# Altium schematic sheet CGM.SchDoc: CGM
size B; Author: Rahimzadeh; SheetNumber: 1; SheetTotal: 1
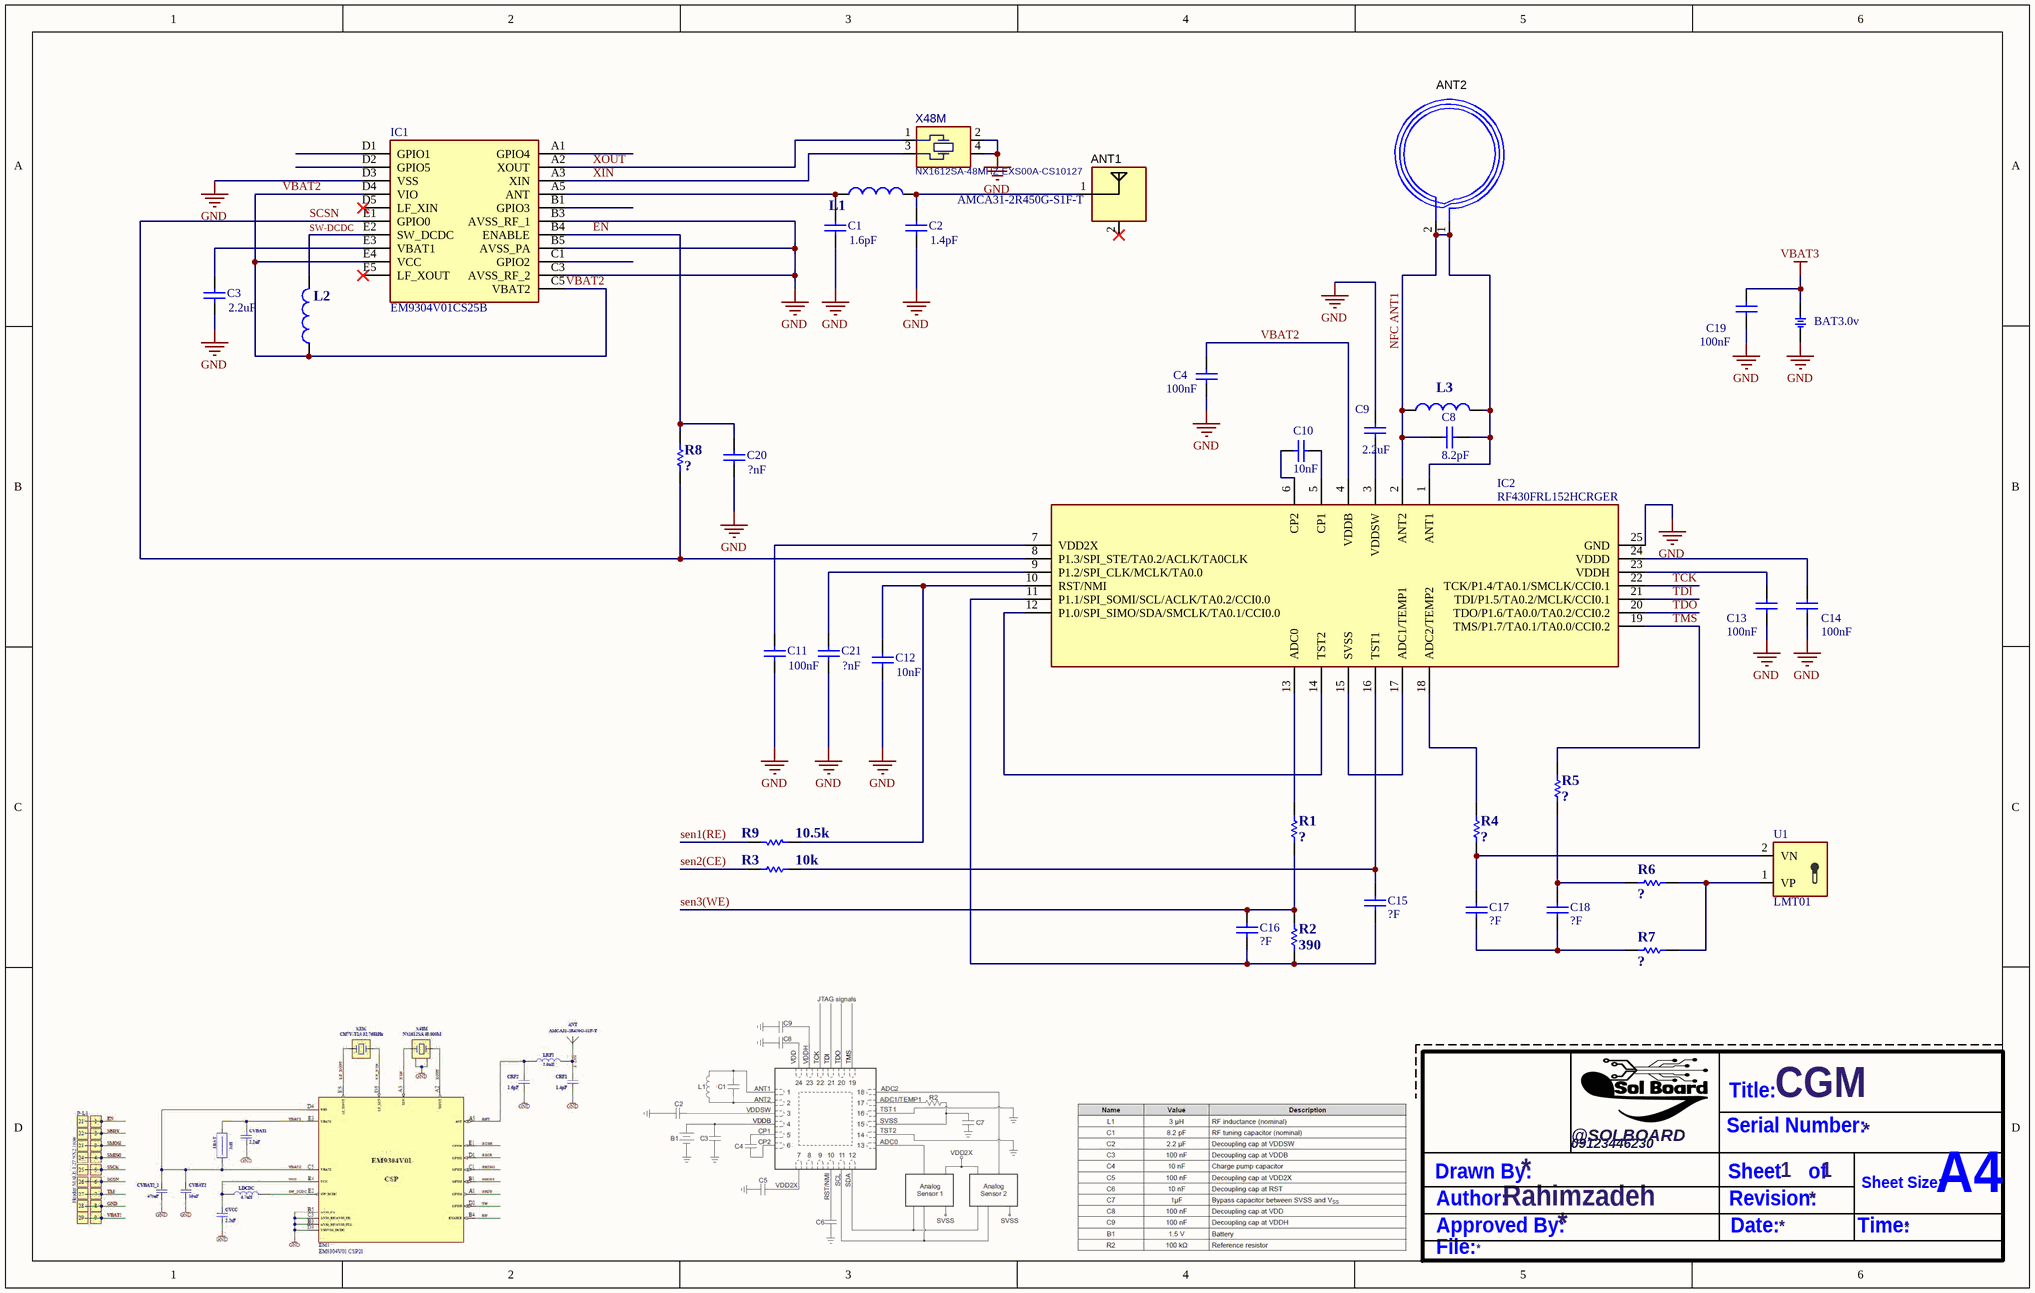
[diagram p0: CGM.SchDoc]

## Parts
ANT1  AMCA31-2R450G-S1F-T  [ANTC3216X140N]  (net tie, no BOM)
ANT2  (no value)  [NFC ANTENNA]  (graphical)
BT1  BAT3.0v  [BTH]
C1  value 1.6pF  [0201]  (hidden comment: Cap)
C2  value 1.4pF  [0201]  (hidden comment: Cap)
C3  value 2.2uF  [0201]  (hidden comment: Cap)
C4  value 100nF  [0201]  (hidden comment: Cap)
C8  value 8.2pF  [0201]  (hidden comment: Cap)
C9  value 2.2uF  [ESD0603]  (hidden comment: Cap)
C10  value 10nF  [0201]  (hidden comment: Cap)
C11  value 100nF  [0201]  (hidden comment: Cap)
C12  value 10nF  [0201]  (hidden comment: Cap)
C13  value 100nF  [0201]  (hidden comment: Cap)
C14  value 100nF  [0201]  (hidden comment: Cap)
C15  value ?F  [ESD0603]  (hidden comment: Cap)
C16  value ?F  [ESD0603]  (hidden comment: Cap)
C17  value ?F  [0201]  (hidden comment: Cap)
C18  value ?F  [0201]  (hidden comment: Cap)
C19  value 100nF  [0402]  (hidden comment: Cap)
C20  value ?nF  [0201]  (hidden comment: Cap)
C21  value ?nF  [0201]  (hidden comment: Cap)
IC1  EM9304V01CS25B  [EM9304V01CS25B]
IC2  RF430FRL152HCRGER  [QFN50P400X400X100-25N-D]
L1  (no value)  [0201]
L2  (no value)  [ESD0603]
L3  (no value)  [0201]
R1  Res1  [0201]  (value not drawn)
R2  value 390  [ESD0603]  (hidden comment: Res1)
R3  value 10k  [0402]  (hidden comment: Res1)
R4  Res1  [0201]  (value not drawn)
R5  Res1  [0201]  (value not drawn)
R6  Res1  [0402]  (value not drawn)
R7  Res1  [0201]  (value not drawn)
R8  Res1  [0201]  (value not drawn)
R9  value 10.5k  [0201]  (hidden comment: Res1)
U1  LMT01  [Temp sensor]
X48M  NX1612SA-48MHZ-EXS00A-CS10127  [NX1612SA48MHZEXS00ACS10127]

## Nets
GND: BT1.2 C1.1 C2.1 C3.1 C4.1 C9.2 C11.1 C12.1 C13.1 C14.1 C19.1 C20.1 C21.1 IC1.B3(AVSS_RF_1) IC1.B5(AVSS_PA) IC1.C3(AVSS_RF_2) IC1.D3(VSS) IC2.25(GND) X48M.2 X48M.4
VBAT3: BT1.1 C19.2
EN: C20.2 IC1.B4(ENABLE) R8.2
NFC ANT1: ANT2.1(FEEDER) ANT2.2(RETURN) C8.1 C8.2 IC2.1(ANT1) IC2.2(ANT2) L3.1 L3.2
SCSN: IC1.E1(GPIO0) IC2.8(P1.3/SPI_STE/TA0.2/ACLK/TA0CLK) R8.1
sen1(RE): R9.1
sen2(CE): R3.1
sen3(WE): C16.1 R1.1 R2.1
SW-DCDC: IC1.E2(SW_DCDC) L2.1
TCK: IC2.22(TCK/P1.4/TA0.1/SMCLK/CCI0.1)
TDI: IC2.21(TDI/P1.5/TA0.2/MCLK/CCI0.1)
TDO: IC2.20(TDO/P1.6/TA0.0/TA0.2/CCI0.2)
TMS: IC2.19(TMS/P1.7/TA0.1/TA0.0/CCI0.2) R5.2
VBAT2: C4.2 IC1.C5(VBAT2) IC1.D4(VIO) IC1.E4(VCC) IC2.4(VDDB) L2.2
XIN: IC1.A3(XIN) X48M.3
XOUT: IC1.A2(XOUT) X48M.1
NetANT1_1: ANT1.1(FEEDER) C2.2 L1.1
NetC1_2: C1.2 IC1.A5(ANT) L1.2
NetC3_2: C3.2 IC1.E3(VBAT1)
NetC9_1: C9.1 IC2.3(VDDSW)
NetC10_1: C10.1 IC2.5(CP1)
NetC10_2: C10.2 IC2.6(CP2)
NetC11_2: C11.2 IC2.7(VDD2X)
NetC12_2: C12.2 IC2.10(RST/NMI) R9.2
NetC13_2: C13.2 IC2.23(VDDH)
NetC14_2: C14.2 IC2.24(VDDD)
NetC15_1: C15.1 IC2.16(TST1) R3.2
NetC15_2: C15.2 C16.2 IC2.11(P1.1/SPI_SOMI/SCL/ACLK/TA0.2/CCI0.0) R2.2
NetC17_1: C17.1 R4.1 U1.2(VN)
NetC17_2: C17.2 C18.2 R7.2
NetC18_1: C18.1 R5.1 R6.2
NetC21_2: C21.2 IC2.9(P1.2/SPI_CLK/MCLK/TA0.0)
NetIC2_12: IC2.12(P1.0/SPI_SIMO/SDA/SMCLK/TA0.1/CCI0.0) IC2.14(TST2)
NetIC2_13: IC2.13(ADC0) R1.2
NetIC2_15: IC2.15(SVSS) IC2.17(ADC1/TEMP1)
NetIC2_18: IC2.18(ADC2/TEMP2) R4.2
NetR6_1: R6.1 R7.1 U1.1(VP)

Not connected (* = marked no-connect by the designer): ANT1 2(RETURN)*; IC1 A1(GPIO4) B1(GPIO3) C1(GPIO2) D1(GPIO1) D2(GPIO5) D5(LF_XIN)* E5(LF_XOUT)*

## Notes on the sheet
- Title:
- Drawn By:
- @SOLBOARD
- 09123446230
- Serial Number:
- Sheet     of
- Author:
- Approved By:
- Revision:
- Date:
- Time:
- Sheet Size:
- A4
- File:

## Library data of the parts
ANT1 = ANT_PCB_2P4G_IFA: Antenna,Microstrip, 2.4GHz; MANF: MANF; MANF_P#: MANF_P#; VALUE: AMCA31-2R450G-S1F-T
ANT2 = NFC ANT: MANF: MANF; MANF_P#: MANF_P#
BT1 = BATT_MS518SE: BATTERY, Lithium, Rechargeable, 6.8mm; MANF: SEIKO; PARAM: 3.4mAH, 10uA charge/discharge; PARAM2: 3V, -20~60°C; MANF_P#: MS518SE; .: http://www.chila.ir; VALUE: BAT3.0v
C1-C4 C8-C21 = Cap: Capacitor; Published: 8-Jun-2000; LatestRevisionDate: 17-Jul-2002; LatestRevisionNote: Re-released for DXP Platform.; PackageReference: RAD-0.3; Publisher: Altium Limited; PackageDescription: Radial Cap, Thru-Hole; 2 Leads; 0.3 in Pin Spacing
IC1 = EM9304V01CS25B: Integrated Circuit; Manufacturer_Name: EM MICROELECTRONIC; Height: 0mm; Manufacturer_Part_Number: EM9304V01CS25B
IC2 = RF430FRL152HCRGER: Integrated Circuit; Manufacturer_Name: Texas Instruments; Datasheet Link: http://www.ti.com/lit/gpn/rf430frl152h; Height: 1mm; Manufacturer_Part_Number: RF430FRL152HCRGER; Mouser Part Number: 595-R430FRL152HCRGER; Mouser Price/Stock: https://www.mouser.co.uk/ProductDetail/Texas-Instruments/RF430FRL152HCRGER?qs=bjKSiFBd6qkz5B9inwiJTw%3D%3D; Arrow Part Number: RF430FRL152HCRGER; Arrow Price/Stock: https://www.arrow.com/en/products/rf430frl152hcrger/texas-instruments?region=nac
L1-L3 = Inductor: Published: 8-Jun-2000; Revision: July-2002: Re-released for DXP Platform.; Publisher: Altium Limited
R1-R9 = Res1: Resistor; Published: 8-Jun-2000; Revision: July-2002: Re-released for DXP Platform.; Publisher: Altium Limited
  R1 R4-R8: Value: ?
U1 = TMP_LMT01_WSON2: SENSOR, TEMP, DIGITAK, -50~150oC, VCC3~5.5v, Pulse interface; MANF_P#: LMT01LPG; MANF: Texas Instruments; PARAM2: PARAM2; VALUE: LMT01
X48M = XTL_4_ABM8_114.285M: CRYSTAL 114.285 MHZ 18PF SMD; MANF: ABRACON; DESC: DESCRIPTION; DIST#: MOUSER; PARAM2: PARAM; PARAM: 20PPM; MANF_P#: ABM8-166-114.285MHZ-T; ASSEMBLY: ASSEMBLY; PRICE: PRICE; VALUE: NX1612SA-48MHZ-EXS00A-CS10127